# Altium schematic sheet RP2350A.SchDoc
size B; SheetNumber: 3; SheetTotal: 4
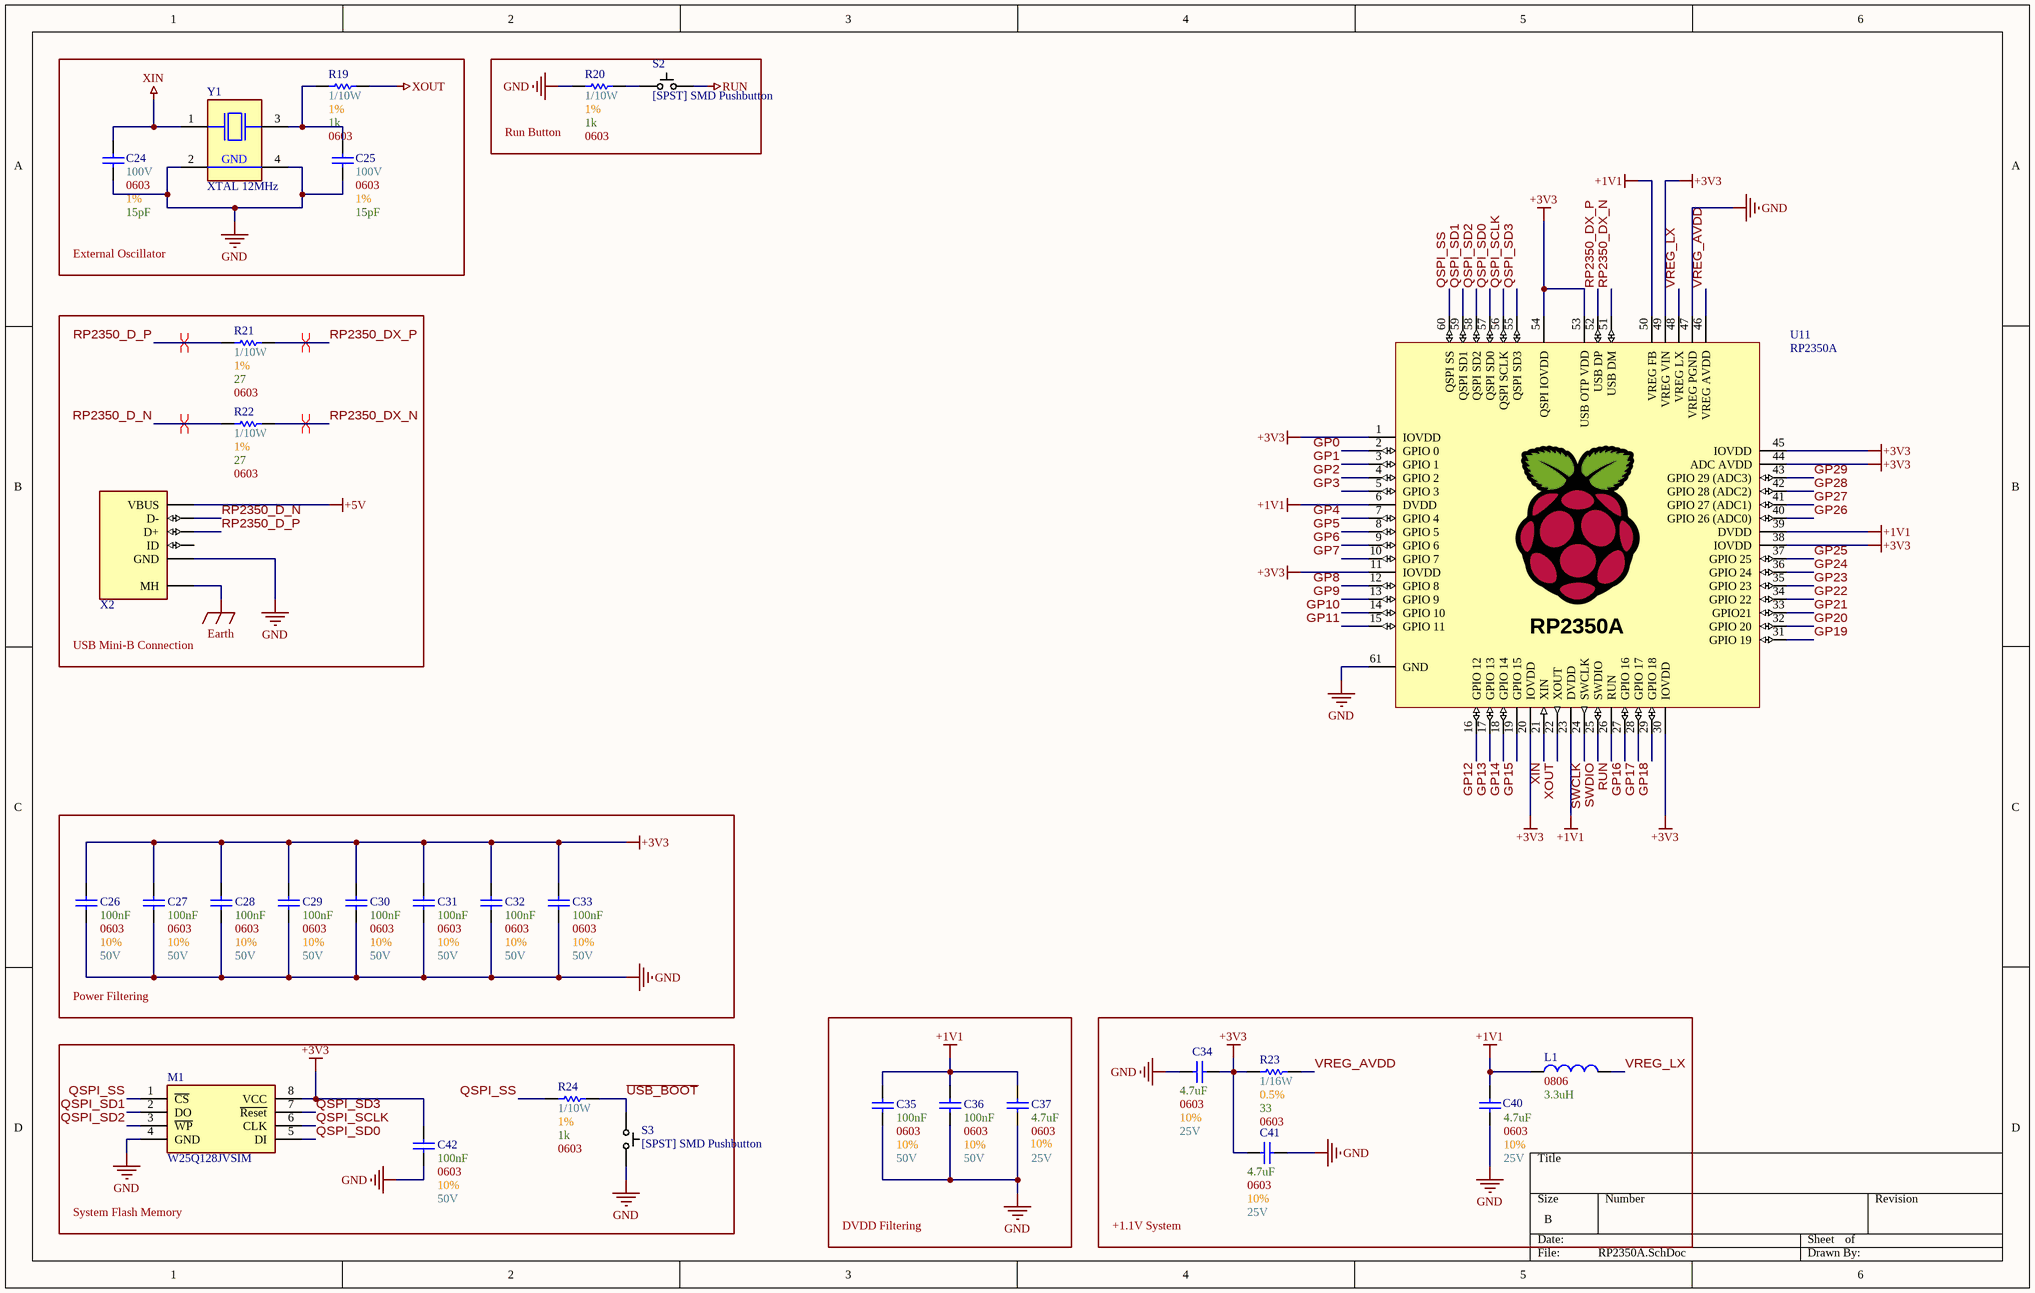
[diagram p0: RP2350A.SchDoc]

## Parts
C24  Max Voltage: 100V  Size Package: 0603  Tolerance: 1%  Capacitance: 15pF  [[Cap] SMD 0603]  (hidden comment: [Cap] 0603 15pF 1% 100V)
C25  Max Voltage: 100V  Size Package: 0603  Tolerance: 1%  Capacitance: 15pF  [[Cap] SMD 0603]  (hidden comment: [Cap] 0603 15pF 1% 100V)
C26  Max Voltage: 50V  Size Package: 0603  Tolerance: 10%  Capacitance: 100nF  [[Cap] SMD 0603]  (hidden comment: [Cap] 0603 0.1uF 10% 50V)
C27  Max Voltage: 50V  Size Package: 0603  Tolerance: 10%  Capacitance: 100nF  [[Cap] SMD 0603]  (hidden comment: [Cap] 0603 0.1uF 10% 50V)
C28  Max Voltage: 50V  Size Package: 0603  Tolerance: 10%  Capacitance: 100nF  [[Cap] SMD 0603]  (hidden comment: [Cap] 0603 0.1uF 10% 50V)
C29  Max Voltage: 50V  Size Package: 0603  Tolerance: 10%  Capacitance: 100nF  [[Cap] SMD 0603]  (hidden comment: [Cap] 0603 0.1uF 10% 50V)
C30  Max Voltage: 50V  Size Package: 0603  Tolerance: 10%  Capacitance: 100nF  [[Cap] SMD 0603]  (hidden comment: [Cap] 0603 0.1uF 10% 50V)
C31  Max Voltage: 50V  Size Package: 0603  Tolerance: 10%  Capacitance: 100nF  [[Cap] SMD 0603]  (hidden comment: [Cap] 0603 0.1uF 10% 50V)
C32  Max Voltage: 50V  Size Package: 0603  Tolerance: 10%  Capacitance: 100nF  [[Cap] SMD 0603]  (hidden comment: [Cap] 0603 0.1uF 10% 50V)
C33  Max Voltage: 50V  Size Package: 0603  Tolerance: 10%  Capacitance: 100nF  [[Cap] SMD 0603]  (hidden comment: [Cap] 0603 0.1uF 10% 50V)
C34  Max Voltage: 25V  Size Package: 0603  Tolerance: 10%  Capacitance: 4.7uF  [[Cap] SMD 0603]  (hidden comment: [Cap] 0603 4.7uF 10% 25V)
C35  Max Voltage: 50V  Size Package: 0603  Tolerance: 10%  Capacitance: 100nF  [[Cap] SMD 0603]  (hidden comment: [Cap] 0603 0.1uF 10% 50V)
C36  Max Voltage: 50V  Size Package: 0603  Tolerance: 10%  Capacitance: 100nF  [[Cap] SMD 0603]  (hidden comment: [Cap] 0603 0.1uF 10% 50V)
C37  Max Voltage: 25V  Size Package: 0603  Tolerance: 10%  Capacitance: 4.7uF  [[Cap] SMD 0603]  (hidden comment: [Cap] 0603 4.7uF 10% 25V)
C40  Max Voltage: 25V  Size Package: 0603  Tolerance: 10%  Capacitance: 4.7uF  [[Cap] SMD 0603]  (hidden comment: [Cap] 0603 4.7uF 10% 25V)
C41  Max Voltage: 25V  Size Package: 0603  Tolerance: 10%  Capacitance: 4.7uF  [[Cap] SMD 0603]  (hidden comment: [Cap] 0603 4.7uF 10% 25V)
C42  Max Voltage: 50V  Size Package: 0603  Tolerance: 10%  Capacitance: 100nF  [[Cap] SMD 0603]  (hidden comment: [Cap] 0603 0.1uF 10% 50V)
L1  Package: 0806  Inductance: 3.3uH  [[Inductor] SMD 0806]  (hidden comment: [3.3uH] SMD 0806 2.1A)
M1  W25Q128JVSIM  [[Flash] 128MBit]
R19  Wattage: 1/10W  Tolerance: 1%  Resistance: 1k  Size Package: 0603  [[Res] SMD 0603]  (hidden comment: [1k] SMD 0603 1% 1/10W)
R20  Wattage: 1/10W  Tolerance: 1%  Resistance: 1k  Size Package: 0603  [[Res] SMD 0603]  (hidden comment: [1k] SMD 0603 1% 1/10W)
R21  Wattage: 1/10W  Tolerance: 1%  Resistance: 27  Size Package: 0603  [[Res] SMD 0603]  (hidden comment: [27] SMD 0603 1% 1/10W)
R22  Wattage: 1/10W  Tolerance: 1%  Resistance: 27  Size Package: 0603  [[Res] SMD 0603]  (hidden comment: [27] SMD 0603 1% 1/10W)
R23  Wattage: 1/16W  Tolerance: 0.5%  Resistance: 33  Size Package: 0603  [[Res] SMD 0603]  (hidden comment: [33] SMD 0603 0.5% 1/16W)
R24  Wattage: 1/10W  Tolerance: 1%  Resistance: 1k  Size Package: 0603  [[Res] SMD 0603]  (hidden comment: [1k] SMD 0603 1% 1/10W)
S2  [SPST] SMD Pushbutton  [[SPST] SMD Pushbutton]
S3  [SPST] SMD Pushbutton  [[SPST] SMD Pushbutton]
U11  RP2350A  [[MCU] RP2350A]
X2  [USB] Type-B Mini  [[USB] Type-B Mini]  (value not drawn)
Y1  XTAL 12MHz  [[Crystal] SMD 12MHz]

## Blocks framed on the sheet
External Oscillator: C24 C25 R19 Y1
Run Button: R20 S2
USB Mini-B Connection: R21 R22 X2
Power Filtering: C26-C33
DVDD Filtering: C35-C37
+1.1V System: C34 C40 C41 L1 R23
System Flash Memory: C42 M1 R24 S3

## Nets
+1V1: C35.2 C36.2 C37.2 C40.1 L1.1 U11.6(DVDD) U11.23(DVDD) U11.39(DVDD) U11.50(VREG_FB)
+3V3: C26.2 C27.2 C28.2 C29.2 C30.2 C31.2 C32.2 C33.2 C34.1 C41.2 C42.2 M1.8(VCC) R23.1 U11.1(IOVDD) U11.11(IOVDD) U11.20(IOVDD) U11.30(IOVDD) U11.38(IOVDD) U11.44(ADC_AVDD) U11.45(IOVDD) U11.49(VREG_VIN) U11.53(USB_OTP_VDD) U11.54(QSPI_IOVDD)
+5V: X2.1(VBUS)
Earth: X2.MH
GND: C24.1 C25.1 C26.1 C27.1 C28.1 C29.1 C30.1 C31.1 C32.1 C33.1 C34.2 C35.1 C36.1 C37.1 C40.2 C41.1 C42.1 M1.4(GND) R20.1 S3.2 U11.47(VREG_PGND) U11.61(GND) X2.5(GND) Y1.2(GND) Y1.4(GND)
RUN: S2.2 U11.26(RUN)
XIN: C24.2 U11.21(XIN) Y1.1(XTAL1)
XOUT: R19.2 U11.22(XOUT)
GP0: U11.2(GPIO_0)
GP1: U11.3(GPIO_1)
GP2: U11.4(GPIO_2)
GP3: U11.5(GPIO_3)
GP4: U11.7(GPIO_4)
GP5: U11.8(GPIO_5)
GP6: U11.9(GPIO_6)
GP7: U11.10(GPIO_7)
GP8: U11.12(GPIO_8)
GP9: U11.13(GPIO_9)
GP10: U11.14(GPIO_10)
GP11: U11.15(GPIO_11)
GP12: U11.16(GPIO_12)
GP13: U11.17(GPIO_13)
GP14: U11.18(GPIO_14)
GP15: U11.19(GPIO_15)
GP16: U11.27(GPIO_16)
GP17: U11.28(GPIO_17)
GP18: U11.29(GPIO_18)
GP19: U11.31(GPIO_19)
GP20: U11.32(GPIO_20)
GP21: U11.33(GPIO21)
GP22: U11.34(GPIO_22)
GP23: U11.35(GPIO_23)
GP24: U11.36(GPIO_24)
GP25: U11.37(GPIO_25)
GP26: U11.40(GPIO_26_(ADC0))
GP27: U11.41(GPIO_27_(ADC1))
GP28: U11.42(GPIO_28_(ADC2))
GP29: U11.43(GPIO_29_(ADC3))
QSPI_SCLK: M1.6(CLK) U11.56(QSPI_SCLK)
QSPI_SD0: M1.5(DI) U11.57(QSPI_SD0)
QSPI_SD1: M1.2(DO) U11.59(QSPI_SD1)
QSPI_SD2: M1.3(~{WP}) U11.58(QSPI_SD2)
QSPI_SD3: M1.7(~{Reset}) U11.55(QSPI_SD3)
QSPI_SS: M1.1(~{CS}) R24.1 U11.60(QSPI_SS)
RP2350_D_N: R22.1 X2.2(D-)
RP2350_D_P: R21.1 X2.3(D+)
RP2350_DX_N: R22.2 U11.51(USB_DM)
RP2350_DX_P: R21.2 U11.52(USB_DP)
SWCLK: U11.24(SWCLK)
SWDIO: U11.25(SWDIO)
~{USB_BOOT}: R24.2 S3.1
VREG_AVDD: R23.2 U11.46(VREG_AVDD)
VREG_LX: L1.2 U11.48(VREG_LX)
NetC25_2: C25.2 R19.1 Y1.3(XTAL2)
NetR20_2: R20.2 S2.1

Not connected (* = marked no-connect by the designer): X2 4(ID)

## Layout directives
differential pair: RP2350_D_N, RP2350_D_P, RP2350_DX_N, RP2350_DX_P

## Library data of the parts
C24 C25 = [Cap] 0603 15pF 1% 100V: GCM1885C2A150FA16D; Supplier 1: DigiKey; Supplier Part Number 1: 490-16416-1-ND
C26-C33 C35 C36 C42 = [Cap] 0603 0.1uF 10% 50V: CL10B104KB8NNNC; Supplier 1: DigiKey; Supplier Part Number 1: 1276-1000-6-ND
C34 C37 C40 C41 = [Cap] 0603 4.7uF 10% 25V: GRM188R61E475KE11D; Supplier 1: DigiKey; Supplier Part Number 1: 490-7203-6-ND
L1 = [3.3uH] SMD 0806 2.1A: AOTA-B201610S3R3-101-T; Supplier 1: DigiKey; Supplier Part Number 1: 535-AOTA-B201610S3R3-101-TCT-ND
M1 = [Flash] 128MBit: Supplier 1: DigiKey; Supplier Part Number 1: W25Q128JVSIM-ND
R19 R20 R24 = [1k] SMD 0603 1% 1/10W: RMCF0603FT1K00; Supplier 1: DigiKey; Supplier Part Number 1: RMCF0603FT1K00DKR-ND
R21 R22 = [27] SMD 0603 1% 1/10W: MCT06030C2709FP500; Supplier 1: DigiKey; Supplier Part Number 1: 749-1631-1-ND
R23 = [33] SMD 0603 0.5% 1/16W: RR0816Q-330-D; Supplier 1: DigiKey; Supplier Part Number 1: RR08Q33DDKR-ND
S2 S3 = [SPST] SMD Pushbutton: PTS815SJM250SMTRLFS; Supplier 1: DigiKey; Supplier Part Number 1: CKN12215-6-ND
U11 = [MCU] RP2350A: QFN-60 Package; Supplier 1: DigiKey; Supplier Part Number 1: 2648-SC1509-A4CT-ND
X2 = [USB] Type-B Mini: MUSB-05-S-B-SM-A-K-TR; Supplier 1: DigiKey; Supplier Part Number 1: SAM14226CT-ND
Y1 = [Crystal] SMD 12MHz: 815-ABM8-272-T3; Supplier 1: DigiKey; Supplier Part Number 1: 535-ABM8-272-T3CT-ND